# Altium schematic sheet 01_Bridge_Stage.SchDoc
size A4; SheetNumber: 1; SheetTotal: 3
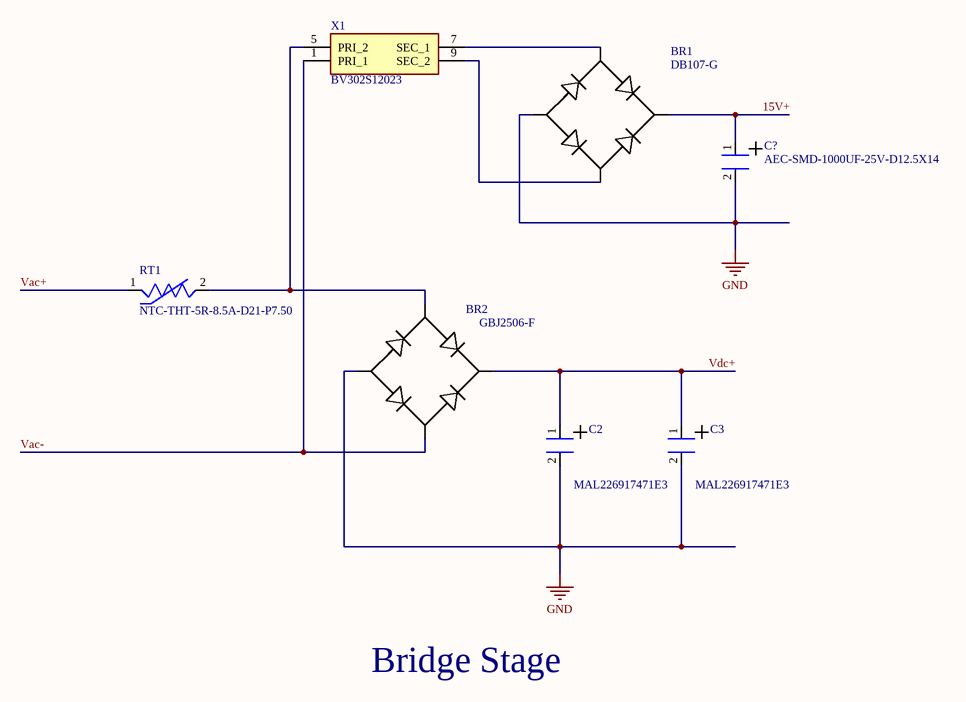
[diagram p0: 01_Bridge_Stage.SchDoc]

## Parts
BR1  DB107-G  [895_DB107-G]
BR2  GBJ2506-F  [996_GBJ2506-F]
C2  MAL226917471E3  [099_MAL226917471E3]
C3  MAL226917471E3  [099_MAL226917471E3]
C?  AEC-SMD-1000UF-25V-D12.5X14  [096_AEC-SMD-1000UF-25V-D12.5X14]
RT1  NTC-THT-5R-8.5A-D21-P7.50  [308_NTC-THT-5R-8.5A-D21-P7.50]
X1  BV302S12023  [899_BV302S12023]

## Nets
GND: BR1.2 BR2.4 C2.2 C3.2 C?.2
15V+: BR1.1 C?.1
Vac+: RT1.1
Vac-: BR2.3 X1.1(PRI_1)
Vdc+: BR2.1 C2.1 C3.1
NetBR1_3: BR1.3 X1.7(SEC_1)
NetBR1_4: BR1.4 X1.9(SEC_2)
NetBR2_2: BR2.2 RT1.2 X1.5(PRI_2)

## Notes on the sheet
- Bridge Stage

## Library data of the parts
BR1 = DB107-G: Single-phase bridge rectifier, 1 A, 1000 V, 4-pin through-hole DB package. Rectifies the auxiliary transformer output.; Manufacturer_Name: MCC; Manufacturer_Part_Number: DB107-BP; Copyright: Copyright (C) 2026 Ultra Librarian. All rights reserved.
BR2 = GBJ2506-F: Bridge Rectifier; Manufacturer_Name: Diodes Incorporated; Datasheet Link: https://www.google.co.uk/search?q=diodes+GBJ2506-F&rlz=1C1CHBF_en-GBGB756GB756&oq=diodes+GBJ2506-F&aqs=chrome..69i57j69i64.1269j0j4&sourceid=chrome&ie=UTF-8; Manufacturer_Part_Number: GBJ2506-F; Mouser Part Number: 621-GBJ2506-F; Mouser Price/Stock: https://www.mouser.co.uk/ProductDetail/Diodes-Incorporated/GBJ2506-F?qs=mQbszxtPdlOUVtYxZe82iQ%3D%3D; Arrow Part Number: GBJ2506-F; Arrow Price/Stock: https://www.arrow.com/en/products/gbj2506-f/diodes-incorporated.html?utm_currency=USD&region=europe
C2 C3 = MAL226917471E3: 470 µF, 450 V polarized aluminum electrolytic capacitor, snap-in THT, Ø35 mm body, 10 mm lead spacing, 105 °C rated.
C? = AEC-SMD-1000UF-25V-D12.5X14: Polarized SMD aluminum electrolytic capacitor, 1000 µF, 25 V, Ø12.5 × 14 mm. Filters the auxiliary DC supply.
RT1 = NTC-THT-5R-8.5A-D21-P7.50: Through-hole NTC inrush current limiter, 5 Ω at 25 °C, 8.5 A, Ø21 mm disc, 7.50 mm lead pitch. Limits the DC-link capacitor charging current at power-up.; MF: EPCOS; MP: B57211P0509M301; Package: None; Price: None; Check_prices: https://www.snapeda.com/parts/B57211P0509M301/EPCOS/view-part/?ref=eda; Value: *; SnapEDA_Link: https://www.snapeda.com/parts/B57211P0509M301/EPCOS/view-part/?ref=snap; Availability: In Stock; Purchase-URL: https://pricing.snapeda.com/search?q=B57211P0509M301&ref=eda
X1 = BV302S12023: 2.3VA Encapsulated Transformer 50/60Hz; Manufacturer_Name: Zettler Group; Geometry.Height: 29.8mm; Manufacturer_Part_Number: BV302S12023; Mouser Part Number: *; Mouser Price/Stock: *; Arrow Part Number: *; Arrow Price/Stock: *; Datasheet Link: https://www.zettlermagnetics.com/pdfs/EI30_23.pdf